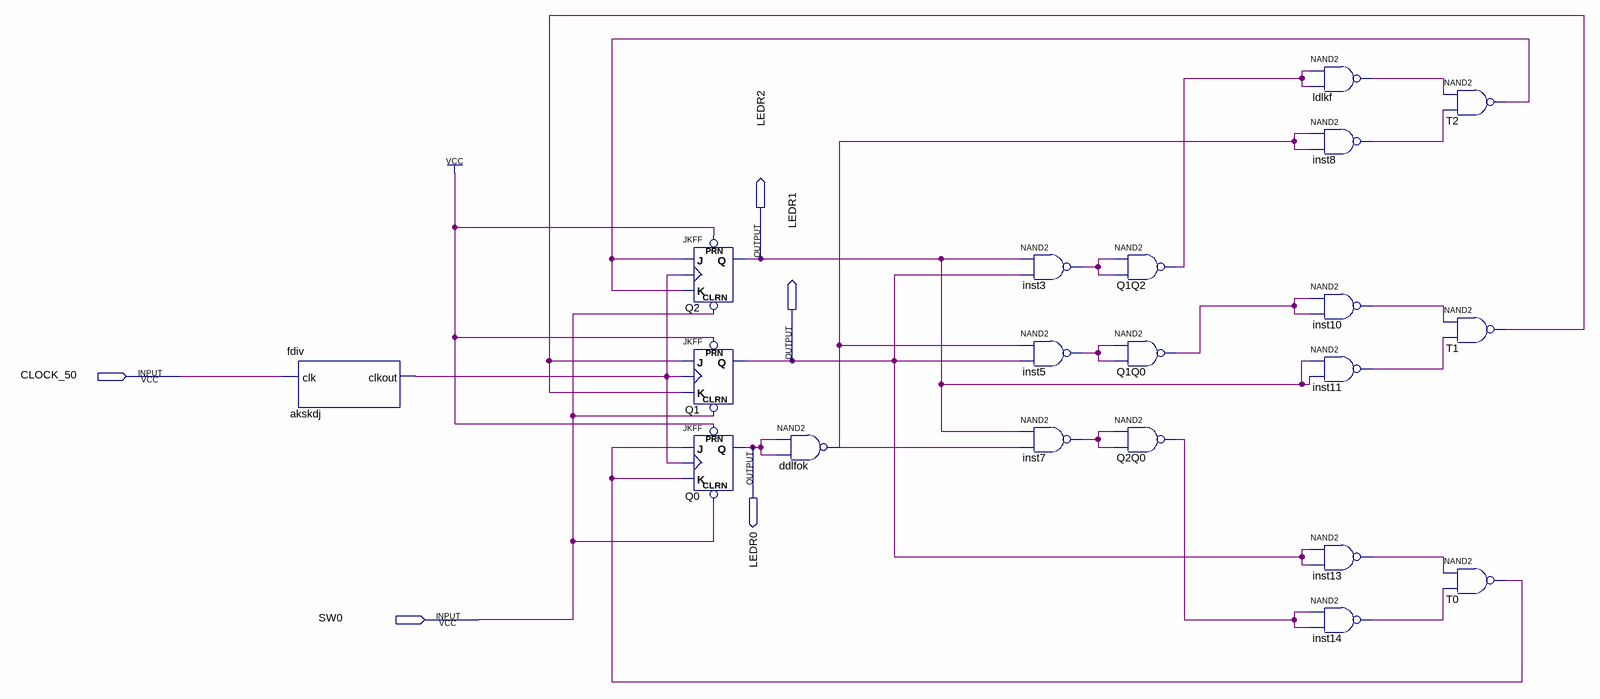
[diagram p0: schematic sheet]
// Quartus schematic experimento24true.bdf as structural Verilog: 20 symbols, 5 pins
module experimento24true (
  input  CLOCK_50,
  input  SW0,
  output LEDR2,
  output LEDR1,
  output LEDR0
);

  wire akskdj_clkout, ddlfok_out, inst3_out, inst5_out, inst7_out, inst8_out, inst10_out, inst11_out,
       inst13_out, inst14_out, ldlkf_out, Q1Q0_out, Q1Q2_out, Q2Q0_out, T0_out, T1_out, T2_out;

  fdiv akskdj (.clk(CLOCK_50), .clkout(akskdj_clkout));
  JKFF Q2 (.PRN(1'b1), .CLRN(SW0), .K(T2_out), .J(T2_out), .CLK(akskdj_clkout), .Q(LEDR2));
  JKFF Q1 (.PRN(1'b1), .CLRN(SW0), .K(T1_out), .J(T1_out), .CLK(akskdj_clkout), .Q(LEDR1));
  JKFF Q0 (.PRN(1'b1), .CLRN(SW0), .K(T0_out), .J(T0_out), .CLK(akskdj_clkout), .Q(LEDR0));
  nand ddlfok (ddlfok_out, LEDR0, LEDR0);
  nand inst3 (inst3_out, LEDR2, LEDR1);
  nand inst5 (inst5_out, ddlfok_out, LEDR1);
  nand inst7 (inst7_out, LEDR2, ddlfok_out);
  nand Q1Q2 (Q1Q2_out, inst3_out, inst3_out);
  nand Q1Q0 (Q1Q0_out, inst5_out, inst5_out);
  nand Q2Q0 (Q2Q0_out, inst7_out, inst7_out);
  nand ldlkf (ldlkf_out, Q1Q2_out, Q1Q2_out);
  nand inst8 (inst8_out, ddlfok_out, ddlfok_out);
  nand inst10 (inst10_out, Q1Q0_out, Q1Q0_out);
  nand inst11 (inst11_out, LEDR2, LEDR2);
  nand inst13 (inst13_out, LEDR1, LEDR1);
  nand inst14 (inst14_out, Q2Q0_out, Q2Q0_out);
  nand T2 (T2_out, ldlkf_out, inst8_out);
  nand T1 (T1_out, inst10_out, inst11_out);
  nand T0 (T0_out, inst13_out, inst14_out);
endmodule
